# Altium schematic sheet MCU.SchDoc
size A2; SheetNumber: 2; SheetTotal: 6
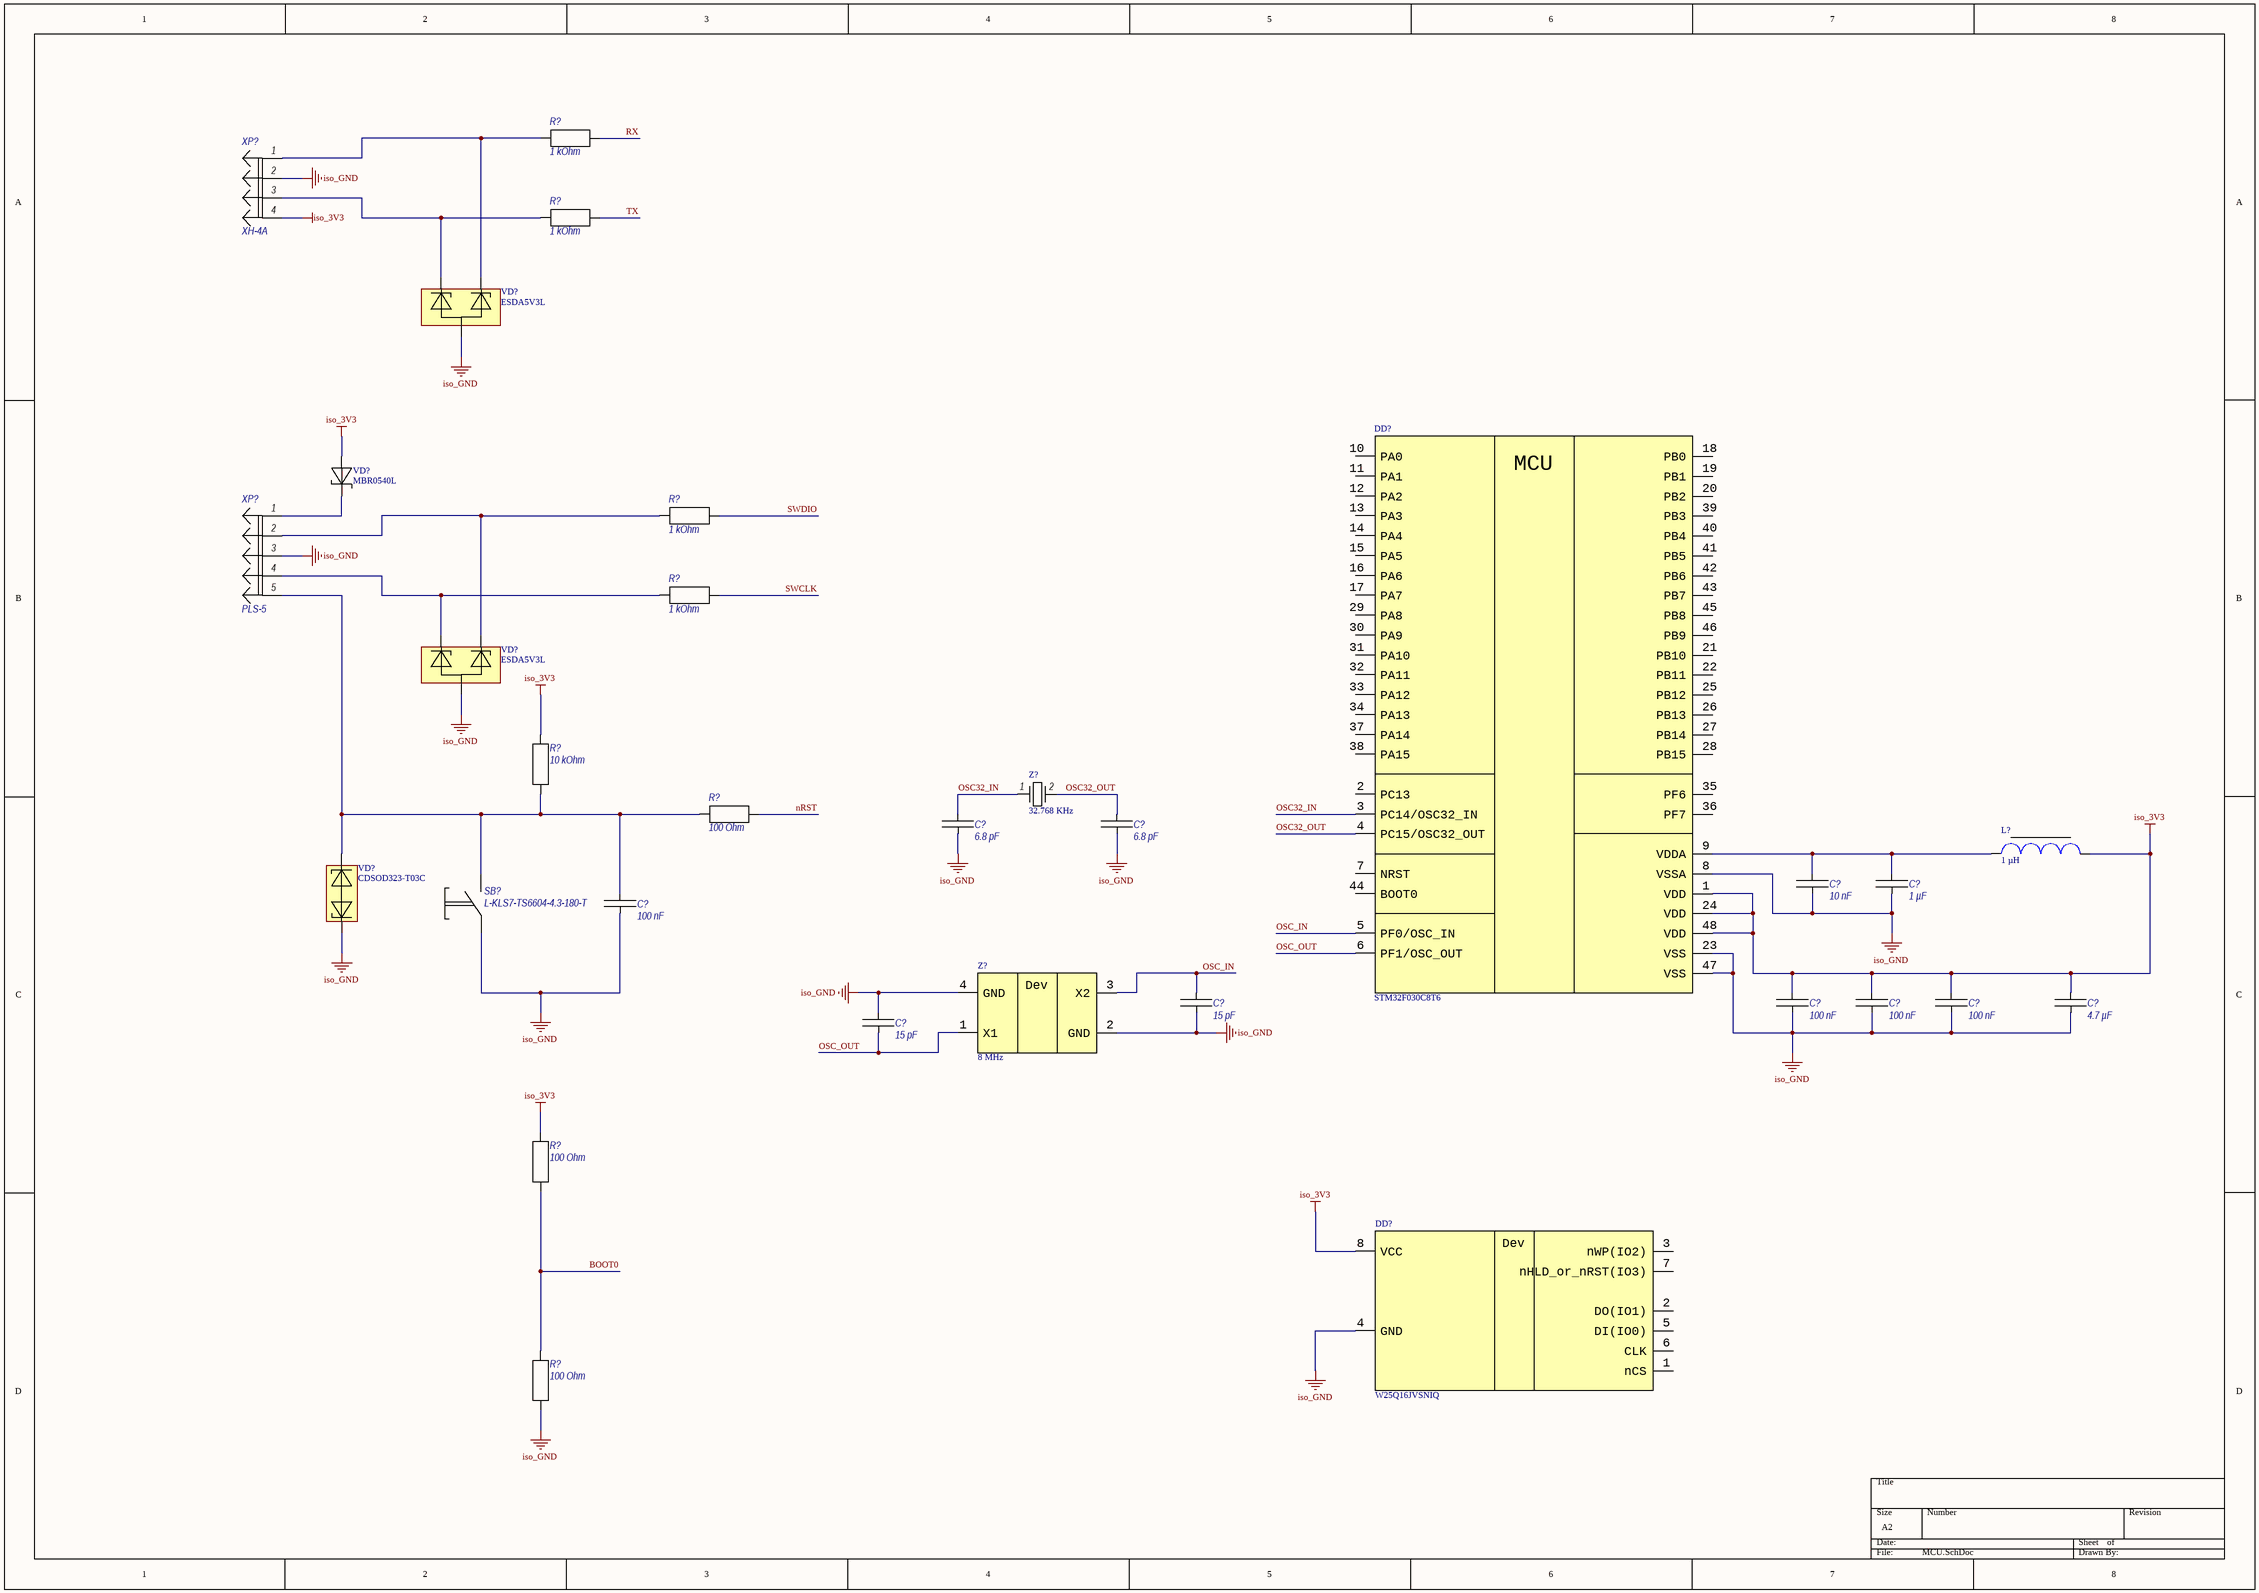
[diagram p0: MCU.SchDoc]

## Parts
(Parts that share a designator on the sheet are numbered #1, #2 ... from top to bottom, then left to right.)
C?#1  6.8 pF  [0603C]
C?#2  6.8 pF  [0603C]
C?#3  10 nF  [0603C]
C?#4  1 µF  [0603C]
C?#5  100 nF  [0603C]
C?#6  15 pF  [0603C]
C?#7  100 nF  [0603C]
C?#8  100 nF  [0603C]
C?#9  100 nF  [0603C]
C?#10  4.7 µF  [0805C]
C?#11  15 pF  [0603C]
DD?#1  STM32F030C8T6  [STM-LQFP48_M]
DD?#2  W25Q16JVSNIQ  [SO-8]
L?  1 µH  [0805L]
R?#1  1 kOhm  [0603R]
R?#2  1 kOhm  [0603R]
R?#3  1 kOhm  [0603R]
R?#4  1 kOhm  [0603R]
R?#5  10 kOhm  [0603R]
R?#6  100 Ohm  [0603R]
R?#7  100 Ohm  [0603R]  (no BOM)
R?#8  100 Ohm  [0603R]
SB?  L-KLS7-TS6604-4.3-180-T  [TACT_SWITCH_6X6]
VD?#1  ESDA5V3L  [SOT-23-3]
VD?#2  MBR0540L  [SOD-123]
VD?#3  ESDA5V3L  [SOT-23-3]
VD?#4  CDSOD323-T03C  [SOD-323]
XP?#1  XH-4A  [XH-2.54-4]
XP?#2  PLS-5  [PLS-5]
Z?#1  32.768 KHz  [CRYSTAL_32X15]
Z?#2  8 MHz  [CRYSTAL_32X25]

## Nets
iso_3V3: C?#7.1 C?#8.1 C?#9.1 C?#10.1 DD?#1.1(VDD) DD?#1.24(VDD) DD?#1.48(VDD) DD?#2.8(VCC) L?.2 R?#5.1 R?#7.1 VD?#2.A XP?#1.4
iso_GND: C?#1.2 C?#2.2 C?#3.2 C?#4.2 C?#5.2 C?#6.2 C?#7.2 C?#8.2 C?#9.2 C?#10.2 C?#11.1 DD?#1.8(VSSA) DD?#1.23(VSS) DD?#1.47(VSS) DD?#2.4(GND) R?#8.2 SB?.1 VD?#1.3 VD?#3.3 VD?#4.A XP?#1.2 XP?#2.3 Z?#2.2(GND) Z?#2.4(GND)
BOOT0: R?#7.2 R?#8.1
nRST: R?#6.1
OSC32_IN: C?#1.1 DD?#1.3(PC14/OSC32_IN) Z?#1.1(OSC1)
OSC32_OUT: C?#2.1 DD?#1.4(PC15/OSC32_OUT) Z?#1.2(OSC2)
OSC_IN: C?#6.1 DD?#1.5(PF0/OSC_IN) Z?#2.3(X2)
OSC_OUT: C?#11.2 DD?#1.6(PF1/OSC_OUT) Z?#2.1(X1)
RX: R?#1.1
SWCLK: R?#4.1
SWDIO: R?#3.1
TX: R?#2.1
NetC?#3_1: C?#3.1 C?#4.1 DD?#1.9(VDDA) L?.1
NetC?#5_1: C?#5.1 R?#5.2 R?#6.2 SB?.2 VD?#4.C XP?#2.5
NetR?#1_2: R?#1.2 VD?#1.1 XP?#1.1
NetR?#2_2: R?#2.2 VD?#1.2 XP?#1.3
NetR?#3_2: R?#3.2 VD?#3.1 XP?#2.2
NetR?#4_2: R?#4.2 VD?#3.2 XP?#2.4
NetVD?#2_C: VD?#2.C XP?#2.1

Not connected (* = marked no-connect by the designer): DD?#1 2(PC13) 7(NRST) 10(PA0) 11(PA1) 12(PA2) 13(PA3) 14(PA4) 15(PA5) 16(PA6) 17(PA7) 18(PB0) 19(PB1) 20(PB2) 21(PB10) 22(PB11) 25(PB12) 26(PB13) 27(PB14) 28(PB15) 29(PA8) 30(PA9) 31(PA10) 32(PA11) 33(PA12) 34(PA13) 35(PF6) 36(PF7) 37(PA14) 38(PA15) 39(PB3) 40(PB4) 41(PB5) 42(PB6) 43(PB7) 44(BOOT0) 45(PB8) 46(PB9); DD?#2 1(nCS) 2(DO(IO1)) 3(nWP(IO2)) 5(DI(IO0)) 6(CLK) 7(nHLD_or_nRST(IO3))

## Notes on the sheet
- (in symbol KSE-7U08000MAB143ZA3) Dev
- (in symbol STM32F030C8T6) MCU
- (in symbol W25Q16JVSNIQ) Dev

## Library data of the parts
C?#1 C?#2 = CL10C6R8CB8NNN: Manufacturer: Samsung; Tolerance: 0.25 pF; Voltage: 50 V; Dielectric: NP0; Part Number: CL10C6R8CB8NNN; Package: 0603; Value: 6.8 pF
C?#3 = CL10B103KB8NNN: Manufacturer: Samsung; Tolerance: 10%; Voltage: 50 V; Dielectric: X7R; Part Number: CL10B103KB8NNN; Package: 0603; Value: 10 nF
C?#4 = CL10B105KB8NNN: Manufacturer: Samsung; Tolerance: 10%; Voltage: 50 V; Dielectric: X7R; Part Number: CL10B105KB8NNN; Package: 0603; Value: 1 µF
C?#5 C?#7-C?#9 = CL10B104KB8NNN: Manufacturer: Samsung; Tolerance: 10%; Voltage: 50 V; Dielectric: X7R; Part Number: CL10B104KB8NNN; Package: 0603; Value: 100 nF
C?#6 C?#11 = CL10C150JB8NNN: Manufacturer: Samsung; Tolerance: 5%; Voltage: 50 V; Dielectric: NP0; Part Number: CL10C150JB8NNN; Package: 0603; Value: 15 pF
C?#10 = CL21B475KPFNNN: Manufacturer: Samsung; Tolerance: 10%; Voltage: 10 V; Dielectric: X7R; Part Number: CL21B475KPFNNN; Package: 0805; Value: 4.7 µF
DD?#1 = STM32F030C8T6: Manufacturer: STMicroelectronics; Part Number: STM32F030C8T6; Package: LQFP48; Datasheet: https://www.alldatasheet.com/datasheet-pdf/view/1132289/STMICROELECTRONICS/STM32F030C8.html
DD?#2 = W25Q16JVSNIQ: SPI flash; Manufacturer: WINBOND; Part Number: W25Q16JVSNIQ; Package: SO-8; Size: 16M-bit; Type: flash; Datasheet: https://static.chipdip.ru/lib/137/DOC012137593.pdf
L? = LQM21FN1R0N00: Manufacturer: MURATA; max Current: 220 mA; Part Number: LQM21FN1R0N00; Package: 0805; Inductance: 1 µH; Datasheet: https://doc.platan.ru/pdf/datasheets/murata/LQM21FN_00.pdf
R?#1-R?#4 = RC0603FR-071KL: Manufacturer: Yageo; Tolerance: 1%; Power: 0.100 Watt; Part Number: RC0603FR-071KL; Package: 0603; Value: 1 kOhm
R?#5 = RC0603FR-0710KL: Manufacturer: Yageo; Tolerance: 1%; Power: 0.100 Watt; Part Number: RC0603FR-0710KL; Package: 0603; Value: 10 kOhm
R?#6-R?#8 = RC0603FR-07100RL: Manufacturer: Yageo; Tolerance: 1%; Power: 0.100 Watt; Part Number: RC0603FR-07100RL; Package: 0603; Value: 100 Ohm
SB? = L-KLS7-TS6604-4.3-180-T: -; Manufacturer: KLS; Current: 50 mA; Voltage: 12 VDC; Resistance: 50 mOhm; Part Number: L-KLS7-TS6604-4.3-180-T; Package: TACT_SWITCH_6X6; Type: Tact switch; Datasheet: https://doc.platan.ru/pdf/datasheets/kls/KLS7-TS6604.pdf
VD?#1 VD?#3 = ESDA5V3L: Manufacturer: UMW; Reverse Voltage: 3.3 V; Part Number: ESDA5V3L; Package: SOT-23-3; max Current: -; Pppm: -; Datasheet: https://static.chipdip.ru/lib/681/DOC059681356.pdf
VD?#2 = MBR0540L: Manufacturer: HOTTECH; max Current: 500 mA; Reverse Voltage: 40 V; Part Number: MBR0540L; Package: SOD-123; Datasheet: https://doc.platan.ru/pdf/datasheets/hottech/MBR0520L-0540L.pdf
VD?#4 = CDSOD323-T03C: Manufacturer: UMW; Reverse Voltage: 3.3 V; Part Number: CDSOD323-T03C; Package: SOD-323; max Current: -; Pppm: -; Datasheet: https://static.chipdip.ru/lib/635/DOC059635678.pdf
XP?#1 = XH-4A: Manufacturer: JST; Imax: 3 A; Umax: 250 V; Mating Connector: XH-4Y; Part Number: XH-4A; Datasheet: www.digikey.es/en/resources/datasheets/jst/xh-connector?srsltid=AfmBOoo9sSFbM4Eu62APurDC7SwqQmd8KbPfwRIn_mEfewP-rqs9ANFl
XP?#2 = PLS-5: Manufacturer: NXU/CONNFLY; Imax: 1 A; Umax: 500 V; Part Number: PLS-5; Mating Connector: -; Datasheet: https://doc.platan.ru/pdf/datasheets/xn/112A.pdf
Z?#1 = KSE-7L32768K7Z2400A3: Manufacturer: Keen Side Electronics; Tolerance: 20 ppm; Load Cap: 7 pF; Part Number: KSE-7L32768K7Z2400A3; Package: 3215; Frequency: 32.768 KHz; Datasheet: https://static.chipdip.ru/lib/163/DOC045163694.pdf
Z?#2 = KSE-7U08000MAB143ZA3: Manufacturer: Keen Side Electronics; Tolerance: 10 ppm; Load Cap: 12 pF; Part Number: KSE-7U08000MAB143ZA3; Package: 3225; Frequency: 8 MHz; Datasheet: https://static.chipdip.ru/lib/163/DOC045163688.pdf